# Altium schematic sheet 05_LEDs_Alimentacion.SchDoc: 05_LEDs_Alimentacion.SchDoc
size Letter; Author: Miguel Donis; Organization: Altium Limited; Address1: L3, 12a Rodborough Rd; Address2: Frenchs Forest; Address3: NSW; Address4: Australia 2086; Revision: 1.0; SheetNumber: 5; SheetTotal: 5; Carnet: 22993; Curso: Digital 2; ProjectName: proyecto 3
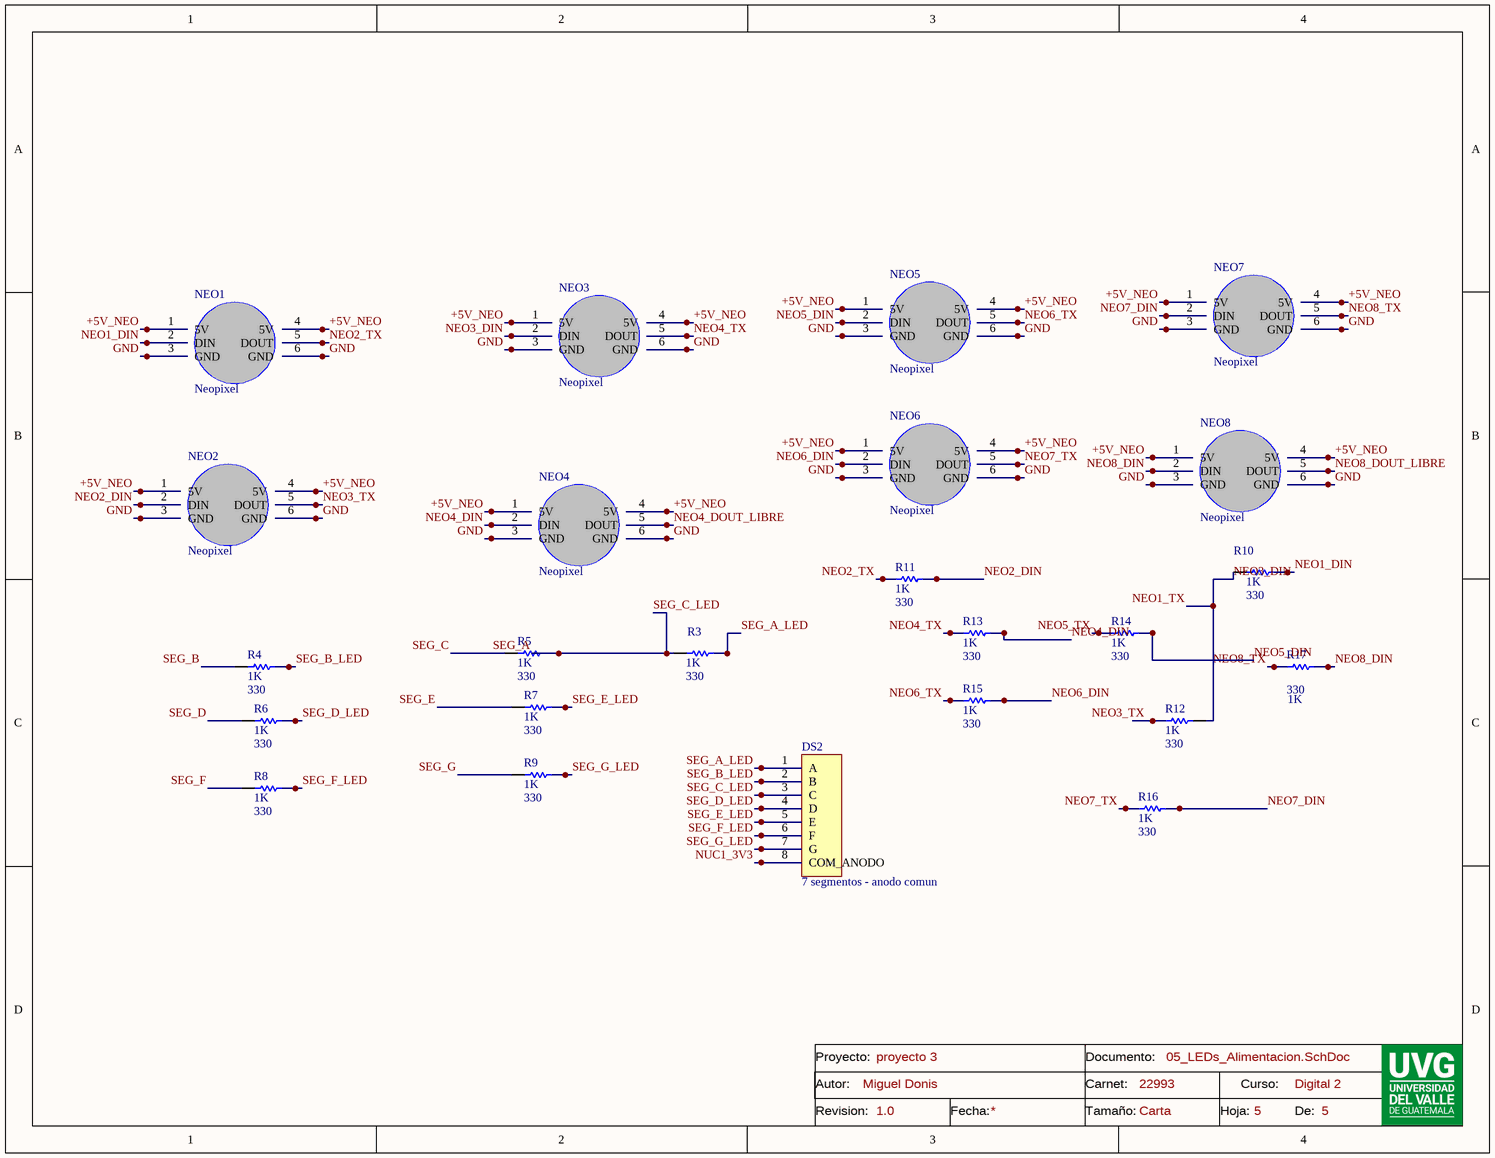
[diagram p0: 05_LEDs_Alimentacion.SchDoc]

## Parts
DS2  7 segmentos - anodo comun
NEO1  Neopixel
NEO2  Neopixel
NEO3  Neopixel
NEO4  Neopixel
NEO5  Neopixel
NEO6  Neopixel
NEO7  Neopixel
NEO8  Neopixel
R3  330  value 1K  [AXIAL-0.3]
R4  330  value 1K  [AXIAL-0.3]
R5  330  value 1K  [AXIAL-0.3]
R6  330  value 1K  [AXIAL-0.3]
R7  330  value 1K  [AXIAL-0.3]
R8  330  value 1K  [AXIAL-0.3]
R9  330  value 1K  [AXIAL-0.3]
R10  330  value 1K  [AXIAL-0.3]
R11  330  value 1K  [AXIAL-0.3]
R12  330  value 1K  [AXIAL-0.3]
R13  330  value 1K  [AXIAL-0.3]
R14  330  value 1K  [AXIAL-0.3]
R15  330  value 1K  [AXIAL-0.3]
R16  330  value 1K  [AXIAL-0.3]
R17  330  value 1K  [AXIAL-0.3]

## Nets
+5V_NEO: NEO1.1(5V) NEO1.4(5V) NEO2.1(5V) NEO2.4(5V) NEO3.1(5V) NEO3.4(5V) NEO4.1(5V) NEO4.4(5V) NEO5.1(5V) NEO5.4(5V) NEO6.1(5V) NEO6.4(5V) NEO7.1(5V) NEO7.4(5V) NEO8.1(5V) NEO8.4(5V)
GND: NEO1.3(GND) NEO1.6(GND) NEO2.3(GND) NEO2.6(GND) NEO3.3(GND) NEO3.6(GND) NEO4.3(GND) NEO4.6(GND) NEO5.3(GND) NEO5.6(GND) NEO6.3(GND) NEO6.6(GND) NEO7.3(GND) NEO7.6(GND) NEO8.3(GND) NEO8.6(GND)
NEO1_DIN: NEO1.2(DIN) R10.2
NEO1_TX: NEO3.2(DIN) R10.1 R12.2  [also labelled NEO3_DIN]
NEO2_DIN: NEO2.2(DIN) R11.2
NEO2_TX: NEO1.5(DOUT) R11.1
NEO3_TX: NEO2.5(DOUT) R12.1
NEO4_DIN: NEO4.2(DIN) R13.2
NEO4_DOUT_LIBRE: NEO4.5(DOUT)
NEO4_TX: NEO3.5(DOUT) R13.1
NEO5_DIN: NEO5.2(DIN) R14.2
NEO5_TX: R14.1
NEO6_DIN: NEO6.2(DIN) R15.2
NEO6_TX: NEO5.5(DOUT) R15.1
NEO7_DIN: NEO7.2(DIN) R16.2
NEO7_TX: NEO6.5(DOUT) R16.1
NEO8_DIN: NEO8.2(DIN) R17.2
NEO8_DOUT_LIBRE: NEO8.5(DOUT)
NEO8_TX: NEO7.5(DOUT) R17.1
NUC1_3V3: DS2.8(COM_ANODO)
SEG_A: DS2.3(C) R3.1 R5.2  [also labelled SEG_C_LED]
SEG_A_LED: DS2.1(A) R3.2
SEG_B: R4.1
SEG_B_LED: DS2.2(B) R4.2
SEG_C: R5.1
SEG_D: R6.1
SEG_D_LED: DS2.4(D) R6.2
SEG_E: R7.1
SEG_E_LED: DS2.5(E) R7.2
SEG_F: R8.1
SEG_F_LED: DS2.6(F) R8.2
SEG_G: R9.1
SEG_G_LED: DS2.7(G) R9.2

## Notes on the sheet
- Proyecto:
- Autor:
- Documento:
- Carnet:
- Curso:
- Revision:
- Fecha:
- Tamaño:
- Carta
- Hoja:
- De:

## Library data of the parts
DS2 = 7SEG
R3-R17 = Res1: Resistor; Published: 8-Jun-2000; LatestRevisionDate: 17-Jul-2002; LatestRevisionNote: Re-released for DXP Platform.; PackageReference: AXIAL-0.3; Publisher: Altium Limited; PackageDescription: Axial Device, Thru-Hole; 2 Leads; 0.3 in Pin Spacing